# Altium project PGS-System.PrjPcb (part 2 of 16)
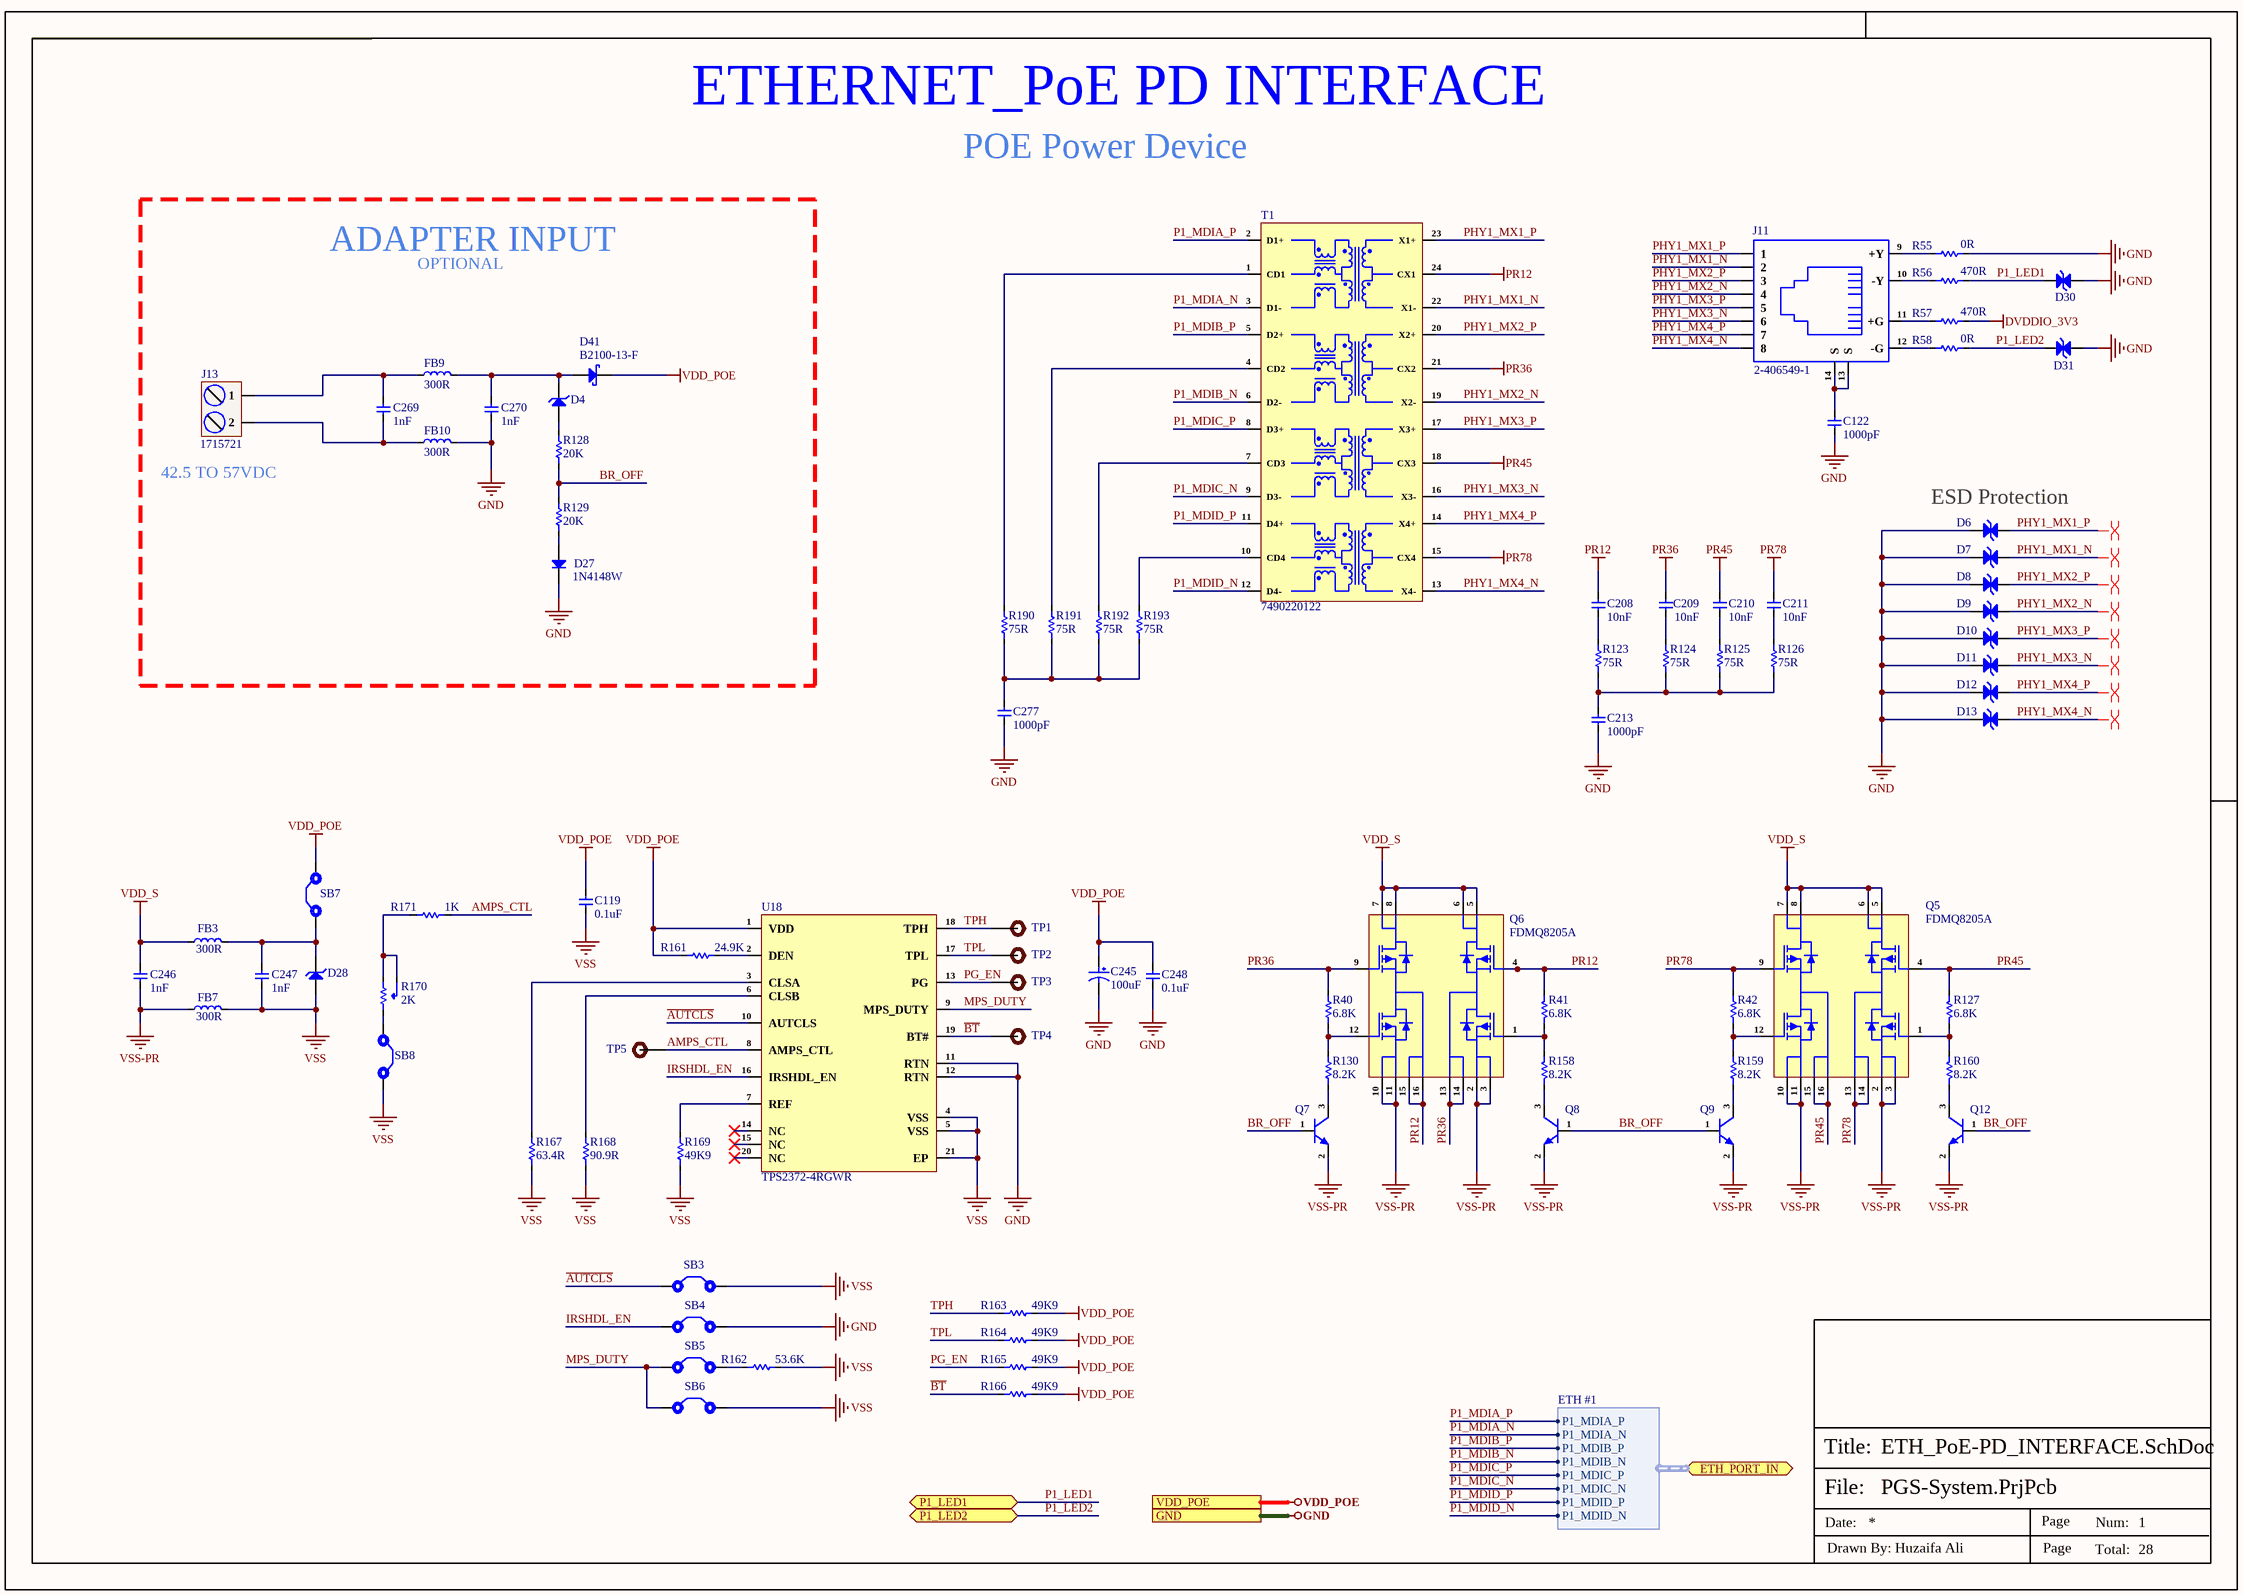
[diagram p106: ETH_PoE-PD_INTERFACE.SchDoc]

## Sheet ETH_PoE-PD_INTERFACE.SchDoc (continued)

### Library data of the parts
C119 C248 = CC0603KRX7R0BB104: CAP CER 0.1UF 100V X7R 0603; Manufacturer: Yageo; Capacitance: 100nF; Tolerance: 10%; Item Type: Capacitor; Supplier 1: Digi-Key; Manufacturer Part Number: CC0603KRX7R0BB104; RoHS: Yes; Category: Ceramic Capacitors; Stock 1: 60476; Pricing 1: 1=0.19000, 10=0.13500, 50=0.07680, 100=0.06370, 500=0.04466, 1000=0.03696 (USD); Mount: Surface Mount; Case/Package: 0603; Case Code (Metric): 1608; Case Code (Imperial): 0603; Weight: 7.1E-05oz; Min Operating Temperature: -55°C; Max Operating Temperature: 125°C; Package Quantity: 4000; Voltage Rating: 100V; Packaging: Tape and Reel; Dielectric: X7R; Termination: SMD/SMT; Resistor Type: Ceramic; Voltage Rating (DC): 100V; Series: CC; Length: 0.063inch; Width: 0.031inch; Thickness: 0.035inch; Depth: 0.8mm; Lead Free: Lead Free; RoHS Compliant: Yes; ComponentLink1URL: https://datasheet.ciiva.com/6277/mlccorderingcode-6277030.pdf?src-supplier=Digi-Key; ComponentLink1Description: https://datasheet.ciiva.com/6277/mlccorderingcode-6277030.pdf?src-supplier=Digi-Key; ComponentLink2URL: https://datasheet.ciiva.com/6277/mlccorderingcode-6277081.pdf?src-supplier=Digi-Key; ComponentLink2Description: https://datasheet.ciiva.com/6277/mlccorderingcode-6277081.pdf?src-supplier=Digi-Key; ComponentLink3URL: https://datasheet.ciiva.com/6277/mlccorderingcode-6277082.pdf?src-supplier=Digi-Key; ComponentLink3Description: https://datasheet.ciiva.com/6277/mlccorderingcode-6277082.pdf?src-supplier=Digi-Key; Supplier Part Number 1: 311-1523-1-ND; LCSC Part Number: C113803
C122 C213 C277 = CC1206KKX7RDBB102: CAP CER 1000PF 2KV X7R 1206; Manufacturer: Yageo; Tolerance: 10%; Capacitance: 1nF; Dissipation Factor: 2.5%; Insulation Resistance: 10GR; Item Type: Capacitor; Supplier 1: Digi-Key; Manufacturer Part Number: CC1206KKX7RDBB102; RoHS: Yes; Category: Ceramic Capacitors; Stock 1: 19260; Pricing 1: 1=0.35000, 10=0.24000, 50=0.16780, 100=0.14390, 500=0.10794, 1000=0.09114 (USD); Mount: Surface Mount; Case/Package: 1206; Number of Pins: 2; Case Code (Metric): 3216; Case Code (Imperial): 1206; Min Operating Temperature: -55°C; Max Operating Temperature: 125°C; Dielectric: X7R; Voltage: 2kV; Package Quantity: 1; Voltage Rating: 2kV; Packaging: Tape and Reel; Voltage Rating (DC): 2kV; Termination: SMD/SMT; Resistor Type: Ceramic; Series: CC; Construction: Flat; Length: 3.2mm; Width: 0.063inch; Height: 1.25mm; Depth: 1.6mm; Thickness: 0.057inch; Radiation Hardening: No; RoHS Compliant: Yes; REACH SVHC: Unknown; Lead Free: Lead Free; ComponentLink1URL: https://datasheet.ciiva.com/23942/1449957-23942422.pdf?src-supplier=Newark; ComponentLink1Description: https://datasheet.ciiva.com/23942/1449957-23942422.pdf?src-supplier=Newark; ComponentLink2URL: https://datasheet.ciiva.com/186/upy-np0x7r-hv-1kv-to-3kv-4-186736.pdf?src-supplier=Digi-Key; ComponentLink2Description: https://datasheet.ciiva.com/186/upy-np0x7r-hv-1kv-to-3kv-4-186736.pdf?src-supplier=Digi-Key; ComponentLink3URL: https://datasheet.ciiva.com/186/upy-np0x7r-hv-1kv-to-3kv-4-186737.pdf?src-supplier=Digi-Key; ComponentLink3Description: https://datasheet.ciiva.com/186/upy-np0x7r-hv-1kv-to-3kv-4-186737.pdf?src-supplier=Digi-Key; ComponentLink4URL: https://datasheet.ciiva.com/13386/upy-gp-np0-16v-to-50v-8-13386312.pdf?src-supplier=Mouser; ComponentLink4Description: https://datasheet.ciiva.com/13386/upy-gp-np0-16v-to-50v-8-13386312.pdf?src-supplier=Mouser; ComponentLink5URL: https://datasheet.ciiva.com/186/upy-np0x7r-hv-1kv-to-3kv-4-186735.pdf?src-supplier=Digi-Key; ComponentLink5Description: https://datasheet.ciiva.com/186/upy-np0x7r-hv-1kv-to-3kv-4-186735.pdf?src-supplier=Digi-Key; Supplier Part Number 1: 311-1487-1-ND; LCSC Part Number: C23631
C208-C211 = CC0402KRX7R9BB103: CAP CER 10000PF 50V X7R 0402; Manufacturer: Yageo; Tolerance: 10%; Item Type: Capacitor; Supplier 1: Avnet; Manufacturer Part Number: CC0402KRX7R9BB103; RoHS: Yes; Category: Ceramic Capacitors; Stock 1: 995000; Pricing 1: 10000=0.00178 (USD); Mount: Surface Mount; Case/Package: 0402; Case Code (Imperial): 0402; Case Code (Metric): 1005; Min Operating Temperature: -55°C; Max Operating Temperature: 125°C; Capacitance: 10nF; Dielectric: X7R; Packaging: Tape and Reel; Voltage Rating: 50V; Voltage Rating (DC): 50V; Package Quantity: 1; Termination: SMD/SMT; Resistor Type: Ceramic; Voltage: 50V; Series: CC; Length: 1mm; Width: 0.02inch; Height: 0.5mm; Thickness: 0.022inch; Depth: 0.5mm; Radiation Hardening: No; RoHS Compliant: Yes; Reach SVHC Compliant: Yes; Lead Free: Lead Free; Halogen Free: Halogen Free; ComponentLink1URL: https://datasheet.ciiva.com/11788/0900766b8079c870-11788375.pdf?src-supplier=RSComponents; ComponentLink1Description: https://datasheet.ciiva.com/11788/0900766b8079c870-11788375.pdf?src-supplier=RSComponents; ComponentLink2URL: https://datasheet.ciiva.com/26862/getdatasheetpartid-138248-26862642.pdf?src-supplier=Verical; ComponentLink2Description: https://datasheet.ciiva.com/26862/getdatasheetpartid-138248-26862642.pdf?src-supplier=Verical; ComponentLink3URL: https://datasheet.ciiva.com/7978/1489800-7978093.pdf?src-supplier=Element14; ComponentLink3Description: https://datasheet.ciiva.com/7978/1489800-7978093.pdf?src-supplier=Element14; ComponentLink4URL: https://datasheet.ciiva.com/28450/1489800-28450377.pdf?src-supplier=Element14; ComponentLink4Description: https://datasheet.ciiva.com/28450/1489800-28450377.pdf?src-supplier=Element14; ComponentLink5URL: https://datasheet.ciiva.com/176/mlccorderingcode-176349.pdf?src-supplier=Digi-Key; ComponentLink5Description: https://datasheet.ciiva.com/176/mlccorderingcode-176349.pdf?src-supplier=Digi-Key; ComponentLink6URL: https://datasheet.ciiva.com/176/mlccorderingcode-176348.pdf?src-supplier=Digi-Key; ComponentLink6Description: https://datasheet.ciiva.com/176/mlccorderingcode-176348.pdf?src-supplier=Digi-Key; ComponentLink7URL: https://datasheet.ciiva.com/176/mlccorderingcode-176350.pdf?src-supplier=Digi-Key; ComponentLink7Description: https://datasheet.ciiva.com/176/mlccorderingcode-176350.pdf?src-supplier=Digi-Key; Supplier Part Number 1: CC0402KRX7R9BB103; LCSC Part Number: C60133
C245 = EEE-FK2A101AM: CAP ALUM 100UF 20% 100V SMD; Manufacturer: Panasonic; Item Type: Capacitor; Ripple Current: 793mA; Impedance: 170mR; Life (Hours): 5000Hour; Dissipation Factor: 0.07%; Supplier: Mouser; LCSC Part Number: C178569; Manufacturer Part Number: EEE-FK2A101AM; RoHS: Yes; Stock: 2720; Pricing: 1=2.26, 10=1.74, 50=1.49, 100=1.49, 1000=1.13, 10000=0.876 (USD); Mounting Technology: Surface Mount,PCB; Case/Package: Radial; Min Operating Temperature: -55°C; Max Operating Temperature: 105°C; Value: 100uF; Voltage Rating: 100V; Tolerance: 20%; Packaging: Tape and Reel; Package Quantity: 1; Voltage Rating (DC): 100V; ESR (Equivalent Series Resistance): 170mR; Ripple Current (AC): 793mA; Termination: SMD/SMT; Voltage: 100V; Series: FK; Construction: Cylindrical; Diameter: 16mm; Length: 16.5mm; Height: 16.5mm; Height - Seated (Max): 0.65inch; Radiation Hardening: No; Reach SVHC Compliant: No; RoHS Compliant: Yes; Lead Free: 5697LeadFree
C246 C247 C269 C270 = 06031C102JAT2A: CAP CER 1000PF 100V X7R 0603; Manufacturer: Kyocera AVX; Item Type: Capacitor; Material: 4241ConductorMaterial; Supplier: Future Electronics; LCSC Part Number: C2179225; Manufacturer Part Number: 06031C102JAT2A; RoHS: Yes; Stock: 32000; Pricing: 4000=0.0243, 12000=0.0234, 20000=0.023, 40000=0.0225, 80000=0.0216 (USD); Lead Free: 5697LeadFree; ComponentLink1URL: https://datasheet.ciiva.com/27056/2011951-27056177.pdf?src-supplier=Jameco; ComponentLink1Description: https://datasheet.ciiva.com/27056/2011951-27056177.pdf?src-supplier=Jameco; ComponentLink2URL: https://datasheet.ciiva.com/2987/cx7r-2987732.pdf?src-supplier=Avnet; ComponentLink2Description: https://datasheet.ciiva.com/2987/cx7r-2987732.pdf?src-supplier=Avnet; ComponentLink3URL: https://datasheet.ciiva.com/151/cx7r-151600.pdf?src-supplier=Digikey; ComponentLink3Description: https://datasheet.ciiva.com/151/cx7r-151600.pdf?src-supplier=Digikey; ComponentLink4URL: https://datasheet.ciiva.com/151/cx7r-151601.pdf?src-supplier=Digikey; ComponentLink4Description: https://datasheet.ciiva.com/151/cx7r-151601.pdf?src-supplier=Digikey; ComponentLink5URL: https://datasheet.ciiva.com/151/cx7r-151602.pdf?src-supplier=Digikey; ComponentLink5Description: https://datasheet.ciiva.com/151/cx7r-151602.pdf?src-supplier=Digikey; ComponentLink6URL: https://datasheet.ciiva.com/1124/1679506-1124194.pdf?src-supplier=Element14; ComponentLink6Description: https://datasheet.ciiva.com/1124/1679506-1124194.pdf?src-supplier=Element14; ComponentLink7URL: https://datasheet.ciiva.com/1124/1679506-1124195.pdf?src-supplier=Element14; ComponentLink7Description: https://datasheet.ciiva.com/1124/1679506-1124195.pdf?src-supplier=Element14; ComponentLink8URL: https://datasheet.ciiva.com/7855/1679506-7855032.pdf?src-supplier=Element14; ComponentLink8Description: https://datasheet.ciiva.com/7855/1679506-7855032.pdf?src-supplier=Element14; ComponentLink9URL: https://datasheet.ciiva.com/16286/cx7r-16286463.pdf?src-supplier=Future+Electronics; ComponentLink9Description: https://datasheet.ciiva.com/16286/cx7r-16286463.pdf?src-supplier=Future+Electronics
D4 = MMSZ5242BS-7-F: DIODE ZENER 12V 200MW SOD323; Manufacturer: Diodes; Supplier: Future Electronics; LCSC Part Number: C151457; Manufacturer Part Number: MMSZ5242BS-7-F; RoHS: Yes; Item Type: Diodes; Stock: 15000; Pricing: 3000=0.0228, 9000=0.022, 15000=0.0216, 60000=0.0206, 90000=0.02 (USD); ComponentLink1URL: https://datasheet.ciiva.com/4734/ds31038-62930-4734288.pdf?src-supplier=Mouser; ComponentLink1Description: https://datasheet.ciiva.com/4734/ds31038-62930-4734288.pdf?src-supplier=Mouser; ComponentLink2URL: https://datasheet.ciiva.com/892/ds31038-892105.pdf?src-supplier=Digikey; ComponentLink2Description: https://datasheet.ciiva.com/892/ds31038-892105.pdf?src-supplier=Digikey; ComponentLink3URL: https://datasheet.ciiva.com/892/ds31038-892106.pdf?src-supplier=Digikey; ComponentLink3Description: https://datasheet.ciiva.com/892/ds31038-892106.pdf?src-supplier=Digikey; ComponentLink4URL: https://datasheet.ciiva.com/892/ds31038-892107.pdf?src-supplier=Digikey; ComponentLink4Description: https://datasheet.ciiva.com/892/ds31038-892107.pdf?src-supplier=Digikey; ComponentLink5URL: https://datasheet.ciiva.com/8347/ds31038-8347977.pdf?src-supplier=Avnet; ComponentLink5Description: https://datasheet.ciiva.com/8347/ds31038-8347977.pdf?src-supplier=Avnet
D6-D13 D30 D31 = ESD9X5VU: DFN1006-2 ESD Protection Devices ROHS; Manufacturer: TECH PUBLIC; Manufacturer Part Number: ESD9X5VU; Footprint: DFN1006-2; ComponentLink1Description: LCSC; ComponentLink1URL: https://www.lcsc.com/product-detail/span-style-background-color-ff0-ESD-span-Protection-Devices_TECH-PUBLIC-ESD9X5VU_C2875160.html; LCSC Part Number: C2875160
D27 = 1N4148W: 100V 400mW Single 1.25V@150mA 8ns 300mA SOD-123 Switching Diode ROHS; Manufacturer: JSMSEMI; ComponentLink1Description: LCSC; ComponentLink1URL: https://www.lcsc.com/product-detail/Switching-Diode_JSMSEMI-1N4148W_C917030.html; Manufacturer Part Number: 1N4148W; Package: SOD-123; LCSC Part Number: C917030; Item Type: Diode
D28 = SMBJ58A-13-F: TVS DIODE 58VWM 93.6VC SMB; Manufacturer: Diodes; Supplier: Future Electronics; LCSC Part Number: C135085; Manufacturer Part Number: SMBJ58A-13-F; RoHS: Yes; Item Type: Diode; Stock: 6000; Pricing: 3000=0.0711, 9000=0.0684, 15000=0.0671, 30000=0.0655, 60000=0.063 (USD); ComponentLink1URL: https://datasheet.ciiva.com/25624/0900766b8104bed2-25624843.pdf?src-supplier=Rs; ComponentLink1Description: https://datasheet.ciiva.com/25624/0900766b8104bed2-25624843.pdf?src-supplier=Rs; ComponentLink2URL: https://datasheet.ciiva.com/15143/getdatasheetpartid-39642-15143045.pdf?src-supplier=Verical; ComponentLink2Description: https://datasheet.ciiva.com/15143/getdatasheetpartid-39642-15143045.pdf?src-supplier=Verical; ComponentLink3URL: https://datasheet.ciiva.com/4520/ds19002-4520617.pdf?src-supplier=Mouser; ComponentLink3Description: https://datasheet.ciiva.com/4520/ds19002-4520617.pdf?src-supplier=Mouser; ComponentLink4URL: https://datasheet.ciiva.com/16393/ds19002-16393005.pdf?src-supplier=Future+Electronics; ComponentLink4Description: https://datasheet.ciiva.com/16393/ds19002-16393005.pdf?src-supplier=Future+Electronics
D41 = B2100-13-F: DIODE SCHOTTKY 100V 2A SMB; Manufacturer: Diodes; Package Body Material: Plastic; Diode Element Material: SILICON; Max Reverse Current: 500uA; Peak Non-Repetitive Surge Current: 50A; Number of Elements: 1; Forward Voltage: 790mV; Polarity: Standard; Value: 75pF; Application(s): EFFICIENCY; Diode Type: RECTIFIER; Time @ Peak Reflow Temperature-Max (s): 5s; Supplier: Future Electronics; LCSC Part Number: C110479; Manufacturer Part Number: B2100-13-F; RoHS: Yes; Item Type: Diode; Stock: 591000; Pricing: 3000=0.0991, 6000=0.0966, 12000=0.0942, 15000=0.0934, 45000=0.0888 (USD); Mounting Technology: Surface Mount; Case/Package: SMB; Pins: 2; Weight: 0.00328oz; Package Shape: Rectangular; Terminal Finish: Tin; Min Operating Temperature: -65°C; Max Operating Temperature: 150°C; Forward Current: 2A; Max Repetitive Reverse Voltage (Vrrm): 100V; Package Quantity: 3000; Packaging: Tape and Reel; Average Rectified Current: 2A; Max Forward Surge Current (Ifsm): 50A; Termination: SMD/SMT; Voltage Rating (DC): 100V; Current Rating: 2A; Output Current: 2A; Max Reverse Voltage (DC): 100V; Series: -; JESD-30 Code: R-PDSO-C2; Terminal Form: C BEND; Terminal Position: DUAL; Number of Phases: 1; Surface Mount: Yes; Moisture Sensitivity Level: 1; Technology: SCHOTTKY; Peak Reflow Temperature (Cel): 245°C; Reverse Voltage: 100V; Length: 4.57mm; Width: 3.94mm; Height: 2.62mm; Radiation Hardening: No; Reach SVHC Compliant: No; Lead Free: Lead Free; RoHS Compliant: Yes; ComponentLink1URL: https://datasheet.ciiva.com/34302/1538742-34302357.pdf?src-supplier=Jameco; ComponentLink1Description: https://datasheet.ciiva.com/34302/1538742-34302357.pdf?src-supplier=Jameco; ComponentLink2URL: https://datasheet.ciiva.com/1177/ds30021-1177418.pdf?src-supplier=Element14; ComponentLink2Description: https://datasheet.ciiva.com/1177/ds30021-1177418.pdf?src-supplier=Element14; ComponentLink3URL: https://datasheet.ciiva.com/4715/ds30021-83821-4715727.pdf?src-supplier=Mouser; ComponentLink3Description: https://datasheet.ciiva.com/4715/ds30021-83821-4715727.pdf?src-supplier=Mouser; ComponentLink4URL: https://datasheet.ciiva.com/8300/ds30021-8300525.pdf?src-supplier=Avnet; ComponentLink4Description: https://datasheet.ciiva.com/8300/ds30021-8300525.pdf?src-supplier=Avnet; ComponentLink5URL: https://datasheet.ciiva.com/16217/ds30021-16217820.pdf?src-supplier=Future+Electronics; ComponentLink5Description: https://datasheet.ciiva.com/16217/ds30021-16217820.pdf?src-supplier=Future+Electronics; ComponentLink6URL: https://datasheet.ciiva.com/8303/ds30021-8303003.pdf?src-supplier=Avnet; ComponentLink6Description: https://datasheet.ciiva.com/8303/ds30021-8303003.pdf?src-supplier=Avnet; ComponentLink7URL: https://datasheet.ciiva.com/913/ds30021-913956.pdf?src-supplier=Digikey; ComponentLink7Description: https://datasheet.ciiva.com/913/ds30021-913956.pdf?src-supplier=Digikey; ComponentLink8URL: https://datasheet.ciiva.com/913/ds30021-913957.pdf?src-supplier=Digikey; ComponentLink8Description: https://datasheet.ciiva.com/913/ds30021-913957.pdf?src-supplier=Digikey; ComponentLink9URL: https://datasheet.ciiva.com/913/ds30021-913955.pdf?src-supplier=Digikey; ComponentLink9Description: https://datasheet.ciiva.com/913/ds30021-913955.pdf?src-supplier=Digikey
FB3 FB7 FB9 FB10 = 742792641: FERRITE BEAD 300 OHM 0603 1LN; Manufacturer: Wurth Electronics; RMS Current (Irms): 2A; ESR: 150mR; Tolerance: 25%; Number of Lines: 1; Test Frequency: 100MHz; Value: 18nH; Supplier: Digikey; LCSC Part Number: C2649308; Manufacturer Part Number: 742792641; RoHS: Yes; Item Type: Ferrite Bead; Stock: 95770; Pricing: 1=0.18, 50=0.179, 100=0.165, 500=0.158, 1000=0.15, 2000=0.143 (USD); Mounting Technology: Surface Mount; Case/Package: SMD/SMT; Weight: 0.000141oz; Core Material: Ferrite; Case Code (Metric): 1608; Case Code (Imperial): 0603; Material: Ferrite; Min Operating Temperature: -55°C; Max Operating Temperature: 125°C; Package Quantity: 1; Current Rating: 2A; Packaging: Tape and Reel; Impedance: 300R; Max Current Rating: 2A; Max DC Current: 2A; Termination: SMD/SMT; Series: WE-CBF; Length: 1.6mm; Width: 0.8mm; Height: 0.8mm; Depth: 0.8mm; Lead Free: Lead Free; Reach SVHC Compliant: Unknown; RoHS Compliant: Yes; ComponentLink1URL: https://datasheet.ciiva.com/1466/1705830-1466501.pdf?src-supplier=Element14; ComponentLink1Description: https://datasheet.ciiva.com/1466/1705830-1466501.pdf?src-supplier=Element14; ComponentLink2URL: https://datasheet.ciiva.com/11800/0900766b80d2e072-11800409.pdf?src-supplier=Rs; ComponentLink2Description: https://datasheet.ciiva.com/11800/0900766b80d2e072-11800409.pdf?src-supplier=Rs; ComponentLink3URL: https://datasheet.ciiva.com/4940/742792641-72209-4940450.pdf?src-supplier=Mouser; ComponentLink3Description: https://datasheet.ciiva.com/4940/742792641-72209-4940450.pdf?src-supplier=Mouser; ComponentLink4URL: https://datasheet.ciiva.com/1013/742792641-1013888.pdf?src-supplier=Digikey; ComponentLink4Description: https://datasheet.ciiva.com/1013/742792641-1013888.pdf?src-supplier=Digikey; ComponentLink5URL: https://datasheet.ciiva.com/1466/1705830-1466502.pdf?src-supplier=Element14; ComponentLink5Description: https://datasheet.ciiva.com/1466/1705830-1466502.pdf?src-supplier=Element14; ComponentLink6URL: https://datasheet.ciiva.com/1013/742792641-1013889.pdf?src-supplier=Digikey; ComponentLink6Description: https://datasheet.ciiva.com/1013/742792641-1013889.pdf?src-supplier=Digikey
J11 = 2-406549-1: CONN MOD JACK 8P8C R/A SHIELDED; Manufacturer: TE Connectivity; Item Type: Ethernet Connectors; Supplier: Future Electronics; LCSC Part Number: C125068; Manufacturer Part Number: 2-406549-1; RoHS: Yes; Stock: 6608; Pricing: 1=2.16, 30=2.1, 100=2.04, 200=2, 500=1.9 (USD)
J13 = 1715721: TERM BLK 2P SIDE ENT 5.08MM PCB; Manufacturer: Phoenix Contact; Item Type: Terminal Blocks; Supplier: Digikey; Supplier Part Number: 277-1263-ND; Manufacturer Part Number: 1715721; RoHS: Yes; Stock: 13160; Pricing: 1=0.94 (USD); ComponentLink1URL: https://datasheet.ciiva.com/1120/1697161-1120393.pdf?src-supplier=Farnell; ComponentLink1Description: https://datasheet.ciiva.com/1120/1697161-1120393.pdf?src-supplier=Farnell; ComponentLink2URL: https://datasheet.ciiva.com/832/1715721-832095.pdf?src-supplier=Digikey; ComponentLink2Description: https://datasheet.ciiva.com/832/1715721-832095.pdf?src-supplier=Digikey; ComponentLink3URL: https://datasheet.ciiva.com/15169/getdatasheetpartid-212174-15169929.pdf?src-supplier=Verical; ComponentLink3Description: https://datasheet.ciiva.com/15169/getdatasheetpartid-212174-15169929.pdf?src-supplier=Verical; ComponentLink4URL: https://datasheet.ciiva.com/16046/1715721-16046034.pdf?src-supplier=Onlinecomponents.com; ComponentLink4Description: https://datasheet.ciiva.com/16046/1715721-16046034.pdf?src-supplier=Onlinecomponents.com
Q5 Q6 = FDMQ8205A: GREENBRIDGETM 2 SERIES OF HIGH-E; Manufacturer: ON Semiconductor / Fairchild; Item Type: Mosfet; FET Type: N and P-Channel; Operating Supply Current: 400uA; Max Power Dissipation: 780mW; Max Supply Voltage: 57V; Number of Outputs: 2NUMBER; Supplier: Mouser; Supplier Part Number: 512-FDMQ8205A; Manufacturer Part Number: FDMQ8205A; RoHS: Yes; Stock: 84; Pricing: 1=3.2, 10=2.69, 50=2.69, 100=2.18, 1000=1.66, 10000=1.56 (USD); Mounting Technology: Surface Mount; Weight: 0.21g; Min Operating Temperature: -40°C; Max Operating Temperature: 85°C; Packaging: Cut Tape; Series: GreenBridge™; Output Voltage: 57V; Height: 800um; RoHS Compliant: Yes; ComponentLink1URL: http://www.farnell.com/datasheets/2724479.pdf?src-supplier=Farnell; ComponentLink1Description: http://www.farnell.com/datasheets/2724479.pdf?src-supplier=Farnell; ComponentLink2URL: http://www.onsemi.com/pub/Collateral/FDMQ8205A-D.pdf?src-supplier=Digikey; ComponentLink2Description: http://www.onsemi.com/pub/Collateral/FDMQ8205A-D.pdf?src-supplier=Digikey; ComponentLink3URL: http://www.farnell.com/datasheets/2724479.pdf?src-supplier=Newark; ComponentLink3Description: http://www.farnell.com/datasheets/2724479.pdf?src-supplier=Newark
Q7-Q9 Q12 = MMBTA06-7-F: TRANS NPN 80V 0.5A SOT23-3; Manufacturer: Diodes; Item Type: BJTs; Current Rating: 500mA; Supplier: Future Electronics; Supplier Part Number: 2136300; Manufacturer Part Number: MMBTA06-7-F; RoHS: Yes; Stock: 573000; Pricing: 3000=0.021, 9000=0.0202, 30000=0.0194, 60000=0.019, 120000=0.0182 (USD); Voltage Rating (DC): 80V; Lead Free: 5697LeadFree; ComponentLink1URL: https://datasheet.ciiva.com/19482/1540800-19482686.pdf?src-supplier=Jameco; ComponentLink1Description: https://datasheet.ciiva.com/19482/1540800-19482686.pdf?src-supplier=Jameco; ComponentLink2URL: https://datasheet.ciiva.com/15139/getdatasheetpartid-116057-15139325.pdf?src-supplier=Verical; ComponentLink2Description: https://datasheet.ciiva.com/15139/getdatasheetpartid-116057-15139325.pdf?src-supplier=Verical; ComponentLink3URL: https://datasheet.ciiva.com/972/ds30037-972971.pdf?src-supplier=Digikey; ComponentLink3Description: https://datasheet.ciiva.com/972/ds30037-972971.pdf?src-supplier=Digikey; ComponentLink4URL: https://datasheet.ciiva.com/972/ds30037-972972.pdf?src-supplier=Digikey; ComponentLink4Description: https://datasheet.ciiva.com/972/ds30037-972972.pdf?src-supplier=Digikey; ComponentLink5URL: https://datasheet.ciiva.com/972/ds30037-972973.pdf?src-supplier=Digikey; ComponentLink5Description: https://datasheet.ciiva.com/972/ds30037-972973.pdf?src-supplier=Digikey; ComponentLink6URL: https://datasheet.ciiva.com/11197/ds30037-11197413.pdf?src-supplier=Avnet; ComponentLink6Description: https://datasheet.ciiva.com/11197/ds30037-11197413.pdf?src-supplier=Avnet; ComponentLink7URL: https://datasheet.ciiva.com/4723/ds30037-4723212.pdf?src-supplier=Mouser; ComponentLink7Description: https://datasheet.ciiva.com/4723/ds30037-4723212.pdf?src-supplier=Mouser; ComponentLink8URL: https://datasheet.ciiva.com/22711/1915521-22711756.pdf?src-supplier=Element14; ComponentLink8Description: https://datasheet.ciiva.com/22711/1915521-22711756.pdf?src-supplier=Element14; ComponentLink9URL: https://datasheet.ciiva.com/16298/ds30037-16298441.pdf?src-supplier=Future+Electronics; ComponentLink9Description: https://datasheet.ciiva.com/16298/ds30037-16298441.pdf?src-supplier=Future+Electronics
R40-R42 R127 = RC0402FR-076K8L: RES 6.8K OHM 1% 1/16W 0402; Manufacturer: Yageo; Resistance: 6.8kR; Power Rating: 63mW; Voltage Rating: 50V; Temperature Coefficient: 100ppm/°C; Item Type: Resistor; Supplier 1: Avnet; Manufacturer Part Number: RC0402FR-076K8L; RoHS: Yes; Category: Chip SMD Resistors; Stock 1: 290000; Pricing 1: 10000=0.00085 (USD); Case/Package: 0402; Number of Pins: 2; Case Code (Imperial): 0402; Case Code (Metric): 1005; Size Code: 0402; Min Operating Temperature: -55°C; Max Operating Temperature: 155°C; Packaging: Tape and Reel; Tolerance: 1%; Voltage Rating (DC): 50V; Package Quantity: 1; Termination: SMD/SMT; Resistor Type: Thick Film; Number of Terminations: 2; Max Power Dissipation: 63mW; Features: Moisture Resistant; Series: RC; Construction: Rectangular; Resistance Tolerance: 1%; Technology: THICK FILM; Length: 0.039inch; Width: 0.02inch; Height: 0.016inch; Depth: 0.5mm; Reach SVHC Compliant: Yes; Military Standard: Not; Lead Free: Lead Free; RoHS Compliant: Yes; ComponentLink1URL: https://datasheet.ciiva.com/11819/0900766b80c66297-11819535.pdf?src-supplier=RSComponents; ComponentLink1Description: https://datasheet.ciiva.com/11819/0900766b80c66297-11819535.pdf?src-supplier=RSComponents; ComponentLink2URL: https://datasheet.ciiva.com/2453/pyu-r-int-thick-7-2453500.pdf?src-supplier=Digi-Key; ComponentLink2Description: https://datasheet.ciiva.com/2453/pyu-r-int-thick-7-2453500.pdf?src-supplier=Digi-Key; ComponentLink3URL: https://datasheet.ciiva.com/2453/pyu-r-int-thick-7-2453501.pdf?src-supplier=Digi-Key; ComponentLink3Description: https://datasheet.ciiva.com/2453/pyu-r-int-thick-7-2453501.pdf?src-supplier=Digi-Key; ComponentLink4URL: https://datasheet.ciiva.com/2453/pyu-r-int-thick-7-2453499.pdf?src-supplier=Digi-Key; ComponentLink4Description: https://datasheet.ciiva.com/2453/pyu-r-int-thick-7-2453499.pdf?src-supplier=Digi-Key; ComponentLink5URL: https://datasheet.ciiva.com/12668/pyu-rc0402-51-rohs-l-6-r-12668201.pdf?src-supplier=Mouser; ComponentLink5Description: https://datasheet.ciiva.com/12668/pyu-rc0402-51-rohs-l-6-r-12668201.pdf?src-supplier=Mouser; ComponentLink6URL: https://datasheet.ciiva.com/7850/1018594-7850078.pdf?src-supplier=Element14; ComponentLink6Description: https://datasheet.ciiva.com/7850/1018594-7850078.pdf?src-supplier=Element14; ComponentLink7URL: https://datasheet.ciiva.com/7850/1018594-7850079.pdf?src-supplier=Element14; ComponentLink7Description: https://datasheet.ciiva.com/7850/1018594-7850079.pdf?src-supplier=Element14; ComponentLink8URL: https://datasheet.ciiva.com/16741/pyu-rc0402-51-rohs-l-6-r-16741018.pdf?src-supplier=Future+Electronics; ComponentLink8Description: https://datasheet.ciiva.com/16741/pyu-rc0402-51-rohs-l-6-r-16741018.pdf?src-supplier=Future+Electronics; Supplier Part Number 1: RC0402FR-076K8L; LCSC Part Number: C93940
R55 R58 = RC0402FR-070RL: RES 0 OHM JUMPER 1/16W 0402; Manufacturer: Yageo; Item Type: Resistors; Tolerance: 1%; Power Rating: 62.5mW; Voltage Rating: 50V; Temperature Coefficient: 200ppm/°C; Max Power Dissipation: 63mW; Supplier 1: Mouser; Manufacturer Part Number: RC0402FR-070RL; RoHS: Yes; Stock 1: 8556842; Pricing 1: 1=0.10000, 10=0.01400, 50=0.01400, 100=0.00600, 1000=0.00300, 5000=0.00200, 10000=0.00100 (USD); Mount: Surface Mount; Case/Package: 0402; Contact Plating: Tin,Matte; Case Code (Imperial): 0402; Case Code (Metric): 1005; Size Code: 0402; Min Operating Temperature: -55°C; Max Operating Temperature: 155°C; Resistance: 0R; Resistor Type: Thick Film; Packaging: Tape and Reel; Termination: SMD/SMT; Features: Moisture Resistant; Series: RC; Number of Terminations: 2; Length: 1mm; Width: 0.5mm; Height: 0.35mm; Radiation Hardening: No; Lead Free: Lead Free; RoHS Compliant: Yes; ComponentLink1URL: https://datasheet.ciiva.com/8896/pyu-rc0402-51-rohs-l-6-8896149.pdf?src-supplier=Avnet; ComponentLink1Description: https://datasheet.ciiva.com/8896/pyu-rc0402-51-rohs-l-6-8896149.pdf?src-supplier=Avnet; ComponentLink2URL: https://datasheet.ciiva.com/16790/pyu-rc0402-51-rohs-l-6-r-16790444.pdf?src-supplier=Future+Electronics; ComponentLink2Description: https://datasheet.ciiva.com/16790/pyu-rc0402-51-rohs-l-6-r-16790444.pdf?src-supplier=Future+Electronics; Supplier Part Number 1: 603-RC0402FR-070RL; LCSC Part Number: C106231
R56 R57 = RC0402FR-07470RL: RES 470 OHM 1% 1/16W 0402; Manufacturer: Yageo; Item Type: Resistor; Voltage Rating: 50V; Power Rating: 62.5mW; Temperature Coefficient: 100ppm/°C; Max Power Dissipation: 63mW; Supplier: Avnet; Supplier Part Number: RC0402FR-07470RL; Manufacturer Part Number: RC0402FR-07470RL; RoHS: Yes; Stock: 10000; Pricing: 10000=0.00085 (USD); Case/Package: 0402; Case Code (Metric): 1005; Case Code (Imperial): 0402; Min Operating Temperature: -55°C; Max Operating Temperature: 155°C; Packaging: Tape and Reel; Value: 470R; Tolerance: 1%; Number of Terminations: 2; Working Voltage: 50V; Package Quantity: 1; Resistor Type: Thick Film; Termination: SMD/SMT; Features: Moisture Resistant; Series: RC; Resistance Tolerance: 1%; Construction: Rectangular; Voltage Rating (AC): 50V; Length: 1mm; Width: 0.02inch; Height: 0.016inch; Depth: 0.5mm; Lead Free: Lead Free; Reach SVHC Compliant: No; RoHS Compliant: Yes; Military Standard: Not; ComponentLink1URL: https://datasheet.ciiva.com/46412/1018594-46412838.pdf?src-supplier=Element14; ComponentLink1Description: https://datasheet.ciiva.com/46412/1018594-46412838.pdf?src-supplier=Element14; ComponentLink2URL: https://datasheet.ciiva.com/2453/pyu-r-int-thick-7-2453377.pdf?src-supplier=Digikey; ComponentLink2Description: https://datasheet.ciiva.com/2453/pyu-r-int-thick-7-2453377.pdf?src-supplier=Digikey; ComponentLink3URL: https://datasheet.ciiva.com/2453/pyu-r-int-thick-7-2453378.pdf?src-supplier=Digikey; ComponentLink3Description: https://datasheet.ciiva.com/2453/pyu-r-int-thick-7-2453378.pdf?src-supplier=Digikey; ComponentLink4URL: https://datasheet.ciiva.com/2453/pyu-r-int-thick-7-2453376.pdf?src-supplier=Digikey; ComponentLink4Description: https://datasheet.ciiva.com/2453/pyu-r-int-thick-7-2453376.pdf?src-supplier=Digikey; ComponentLink5URL: https://datasheet.ciiva.com/7850/1018594-7850015.pdf?src-supplier=Element14; ComponentLink5Description: https://datasheet.ciiva.com/7850/1018594-7850015.pdf?src-supplier=Element14; ComponentLink6URL: https://datasheet.ciiva.com/7850/1018594-7850014.pdf?src-supplier=Element14; ComponentLink6Description: https://datasheet.ciiva.com/7850/1018594-7850014.pdf?src-supplier=Element14; ComponentLink7URL: https://datasheet.ciiva.com/15189/getdatasheetpartid-330246-15189463.pdf?src-supplier=Verical; ComponentLink7Description: https://datasheet.ciiva.com/15189/getdatasheetpartid-330246-15189463.pdf?src-supplier=Verical; LCSC Part Number: C114877
R123-R126 R190-R193 = RC0402JR-0775RL: RES 75 OHM 5% 1/16W 0402; Manufacturer: Yageo; Item Type: Resistor; Temperature Coefficient: 100ppm/°C; Power Rating: 62.5mW; Voltage Rating: 50V; Max Power Dissipation: 63mW; Supplier: Digikey; Supplier Part Number: 311-75JRCT-ND; Manufacturer Part Number: RC0402JR-0775RL; RoHS: Yes; Stock: 2993323; Pricing: 1=0.1, 10=0.018, 50=0.0102, 100=0.0083, 500=0.00528, 1000=0.00444, 5000=0.00307 (USD); Case/Package: 0402; Pins: 2; Contact Plating: Tin,Lead; Case Code (Imperial): 0402; Case Code (Metric): 1005; Min Operating Temperature: -55°C; Max Operating Temperature: 155°C; Value: 75R; Tolerance: 5%; Resistor Type: Thick Film; Packaging: Tape and Reel; Termination: SMD/SMT; Voltage Rating (DC): 50V; Features: Moisture Resistant; Series: RC; Number of Terminations: 2; Resistance Tolerance: 5%; Length: 1mm; Width: 0.5mm; Height: 0.35mm; Reach SVHC Compliant: No; Lead Free: Lead Free; RoHS Compliant: Yes; ComponentLink1URL: https://datasheet.ciiva.com/7983/1018594-7983612.pdf?src-supplier=Element14; ComponentLink1Description: https://datasheet.ciiva.com/7983/1018594-7983612.pdf?src-supplier=Element14; ComponentLink2URL: https://datasheet.ciiva.com/17082/pyu-rc0402-51-rohs-l-6-r-17082239.pdf?src-supplier=Future+Electronics; ComponentLink2Description: https://datasheet.ciiva.com/17082/pyu-rc0402-51-rohs-l-6-r-17082239.pdf?src-supplier=Future+Electronics; LCSC Part Number: C137841
R128 R129 = RC0603FR-0720KL: RES 20K OHM 1% 1/10W 0603; Manufacturer: Yageo; Resistance: 20kR; Temperature Coefficient: 100ppm/°C; Voltage Rating (DC): 50V; Power Rating: 100mW; Item Type: Resistor; Supplier 1: Arrow Electronics; Manufacturer Part Number: RC0603FR-0720KL; RoHS: Yes; Category: Chip SMD Resistors; Stock 1: 945000; Pricing 1: 5000=0.00240, 10000=0.00220, 25000=0.00200, 50000=0.00190, 125000=0.00180 (USD); Case/Package: 0603; Number of Pins: 2; Case Code (Imperial): 0603; Case Code (Metric): 1608; Size Code: 0603; Min Operating Temperature: -55°C; Max Operating Temperature: 155°C; Tolerance: 1%; Packaging: Tape and Reel; Resistor Type: Thick Film; Voltage Rating: 50V; Package Quantity: 1; Termination: SMD/SMT; Number of Terminations: 2; Max Power Dissipation: 100mW; Features: Moisture Resistant; Series: RC; Technology: THICK FILM; Construction: Rectangular; Resistance Tolerance: 1%; Length: 0.063inch; Width: 0.031inch; Height: 0.022inch; Depth: 0.8mm; Lead Free: Lead Free; RoHS Compliant: Yes; REACH SVHC: No SVHC; Military Standard: Not; ComponentLink1URL: https://datasheet.ciiva.com/11808/0900766b80f96399-11808275.pdf?src-supplier=RSComponents; ComponentLink1Description: https://datasheet.ciiva.com/11808/0900766b80f96399-11808275.pdf?src-supplier=RSComponents; ComponentLink2URL: https://datasheet.ciiva.com/22747/443971-22747525.pdf?src-supplier=Element14; ComponentLink2Description: https://datasheet.ciiva.com/22747/443971-22747525.pdf?src-supplier=Element14; ComponentLink3URL: https://datasheet.ciiva.com/2453/pyu-r-int-thick-7-2453911.pdf?src-supplier=Digi-Key; ComponentLink3Description: https://datasheet.ciiva.com/2453/pyu-r-int-thick-7-2453911.pdf?src-supplier=Digi-Key; ComponentLink4URL: https://datasheet.ciiva.com/2453/pyu-r-int-thick-7-2453912.pdf?src-supplier=Digi-Key; ComponentLink4Description: https://datasheet.ciiva.com/2453/pyu-r-int-thick-7-2453912.pdf?src-supplier=Digi-Key; ComponentLink5URL: https://datasheet.ciiva.com/2453/pyu-r-int-thick-7-2453910.pdf?src-supplier=Digi-Key; ComponentLink5Description: https://datasheet.ciiva.com/2453/pyu-r-int-thick-7-2453910.pdf?src-supplier=Digi-Key; Supplier Part Number 1: RC0603FR-0720KL; LCSC Part Number: C105575
R130 R158-R160 = RT0402BRD078K2L: RES SMD 8.2K OHM 0.1% 1/16W 0402; Manufacturer: Yageo; Voltage Rating: 50V; Value: 8.2kR; Power Rating: 62.5mW; Temperature Coefficient: 25ppm/°C; Max Power Dissipation: 63mW; Item Type: Resistor; Supplier: Digikey; Supplier Part Number: YAG4318CT-ND; Manufacturer Part Number: RT0402BRD078K2L; RoHS: Yes; Category: Chip SMD Resistors; Stock: 17016; Pricing: 1=0.16, 10=0.121, 50=0.0958, 100=0.0859, 500=0.0654, 1000=0.0578, 5000=0.04283 (USD); Case/Package: 0402; Case Code (Metric): 1005; Case Code (Imperial): 0402; Min Operating Temperature: -55°C; Max Operating Temperature: 155°C; Tolerance: 0.1%; Packaging: Tape and Reel; Package Quantity: 10000; Termination: SMD/SMT; Number of Terminations: 2; Voltage Rating (DC): 50V; Series: RT; Length: 0.039inch; Width: 0.02inch; Height: 0.014inch; Lead Free: Lead Free; RoHS Compliant: Yes; ComponentLink1URL: https://datasheet.ciiva.com/2582/pyu-rt-1-to-0-05-rohs-l-5-2582520.pdf?src-supplier=Digikey; ComponentLink1Description: https://datasheet.ciiva.com/2582/pyu-rt-1-to-0-05-rohs-l-5-2582520.pdf?src-supplier=Digikey; LCSC Part Number: C852943
R161 = 0603WAF2492T5E: 100mW Thick Film Resistors 75V ±100ppm/℃ ±1% 24.9kΩ 0603 Chip Resistor - Surface Mount ROHS; Manufacturer: UNI-ROYAL(Uniroyal Elec); Manufacturer Part Number: 0603WAF2492T5E; Package: 0603; LCSC Part Number: C25962; Item Type: Resistor; ComponentLink1Description: LCSC; ComponentLink1URL: https://www.lcsc.com/product-detail/Chip-Resistor-Surface-Mount_UNI-ROYAL-Uniroyal-Elec-0603WAF2492T5E_C25962.html
R162 = RC0603FR-0753K6L: RES 53.6K OHM 1% 1/10W 0603; Manufacturer: Yageo; Item Type: Resistor; Value: 53.6kR; Temperature Coefficient: 100ppm/°C; Voltage Rating (DC): 50V; Power Rating: 100mW; Supplier: Digikey; LCSC Part Number: C137700; Manufacturer Part Number: RC0603FR-0753K6L; RoHS: Yes; Stock: 308541; Pricing: 1=0.1, 10=0.019, 50=0.0112, 100=0.0093, 500=0.00622, 1000=0.00532 (USD); Mounting Technology: Surface Mount; Case/Package: 0603; Case Code (Imperial): 0603; Case Code (Metric): 1608; Min Operating Temperature: -55°C; Max Operating Temperature: 155°C; Packaging: Tape and Reel; Tolerance: 1%; Voltage Rating: 50V; Termination: SMD/SMT; Features: Moisture Resistant; Series: RC; Max Power Dissipation: 100mW; Number of Terminations: 2; Construction: Rectangular; Technology: THICK FILM; Length: 1.6mm; Height: 0.45mm; Depth: 0.8mm; Lead Free: Lead Free; Military Standard: Not; RoHS Compliant: Yes; ComponentLink1URL: https://datasheet.ciiva.com/11819/0900766b80f96399-11819394.pdf?src-supplier=Rs; ComponentLink1Description: https://datasheet.ciiva.com/11819/0900766b80f96399-11819394.pdf?src-supplier=Rs
R163-R166 R169 = RC0603FR-0749K9L: RES 49.9K OHM 1% 1/10W 0603; Manufacturer: Yageo; Power Rating: 100mW; Resistance: 49.9kR; Temperature Coefficient: 100ppm/°C; Voltage Rating (DC): 50V; Item Type: Resistor; Supplier 1: Digi-Key; Manufacturer Part Number: RC0603FR-0749K9L; RoHS: Yes; Category: Chip SMD Resistors; Stock 1: 77863; Pricing 1: 1=0.10000, 10=0.02400, 100=0.00970, 1000=0.00436, 2500=0.00378 (USD); Mount: Surface Mount; Case/Package: 0603; Case Code (Metric): 1608; Case Code (Imperial): 0603; Size Code: 0603; Min Operating Temperature: -55°C; Max Operating Temperature: 155°C; Tolerance: 1%; Packaging: Tape and Reel; Package Quantity: 1; Voltage Rating: 50V; Resistor Type: Thick Film; Number of Terminations: 2; Termination: SMD/SMT; Max Power Dissipation: 100mW; Features: Moisture Resistant; Series: RC; Construction: Rectangular; Length: 0.063inch; Width: 0.031inch; Height: 0.022inch; Depth: 0.8mm; Lead Free: Lead Free; Military Standard: Not; RoHS Compliant: Yes; ComponentLink1URL: https://datasheet.ciiva.com/2454/pyu-r-int-thick-7-2454042.pdf?src-supplier=Digi-Key; ComponentLink1Description: https://datasheet.ciiva.com/2454/pyu-r-int-thick-7-2454042.pdf?src-supplier=Digi-Key; ComponentLink2URL: https://datasheet.ciiva.com/2454/pyu-r-int-thick-7-2454043.pdf?src-supplier=Digi-Key; ComponentLink2Description: https://datasheet.ciiva.com/2454/pyu-r-int-thick-7-2454043.pdf?src-supplier=Digi-Key; ComponentLink3URL: https://datasheet.ciiva.com/2454/pyu-r-int-thick-7-2454044.pdf?src-supplier=Digi-Key; ComponentLink3Description: https://datasheet.ciiva.com/2454/pyu-r-int-thick-7-2454044.pdf?src-supplier=Digi-Key; ComponentLink4URL: https://datasheet.ciiva.com/15189/getdatasheetpartid-323805-15189749.pdf?src-supplier=Verical; ComponentLink4Description: https://datasheet.ciiva.com/15189/getdatasheetpartid-323805-15189749.pdf?src-supplier=Verical; Supplier Part Number 1: 311-49.9KHRCT-ND; LCSC Part Number: C114624
R167 = AC0603FR-0763R4L: RES SMD 63.4 OHM 1% 1/10W 0603; Manufacturer: Yageo; Item Type: Resistor; Power Rating: 100mW; Voltage Rating: 50V; Temperature Coefficient: 100ppm/°C; Supplier: Digikey; LCSC Part Number: C228004; Manufacturer Part Number: AC0603FR-0763R4L; RoHS: Yes; Stock: 4788; Pricing: 1=0.1, 10=0.021, 50=0.013, 100=0.0108, 500=0.00734, 1000=0.00633 (USD); Case/Package: 0603; Case Code (Imperial): 0603; Case Code (Metric): 1608; Weight: 7.1E-05oz; Min Operating Temperature: -55°C; Max Operating Temperature: 155°C; Tolerance: 1%; Value: 63.4R; Packaging: Tape and Reel; Termination: SMD/SMT; Number of Terminations: 2; Max Power Dissipation: 100mW; Features: Moisture Resistant,Automotive AEC-Q200; Series: AC; Length: 0.063inch; Width: 0.8mm; Height: 0.022inch; RoHS Compliant: Yes; ComponentLink1URL: https://datasheet.ciiva.com/12576/pyu-ac-51-rohs-l-2-12576614.pdf?src-supplier=Mouser; ComponentLink1Description: https://datasheet.ciiva.com/12576/pyu-ac-51-rohs-l-2-12576614.pdf?src-supplier=Mouser
R168 = RT0603BRD0790R9L: RES SMD 90.9 OHM 0.1% 1/10W 0603; Manufacturer: Yageo; Item Type: Resistors; Voltage Rating: 75V; Power Rating: 100mW; Temperature Coefficient: 25ppm/°C; Voltage Rating (DC): 50V; Supplier: Mouser; LCSC Part Number: C861597; Manufacturer Part Number: RT0603BRD0790R9L; RoHS: Yes; Stock: 928; Pricing: 1=0.14, 10=0.104, 50=0.083, 100=0.074, 1000=0.05, 10000=0.032 (USD); Case/Package: 0603; Case Code (Metric): 1608; Case Code (Imperial): 0603; Min Operating Temperature: -55°C; Max Operating Temperature: 155°C; Value: 90.9R; Tolerance: 0.1%; Packaging: Tape and Reel; Termination: SMD/SMT; Series: RT; Max Power Dissipation: 100mW; Number of Terminations: 2; Length: 1.6mm; Width: 800um; Height: 450um; Lead Free: Lead Free; RoHS Compliant: Yes; ComponentLink1URL: https://datasheet.ciiva.com/12721/pyu-rt-1-to-0-05-rohs-l-4-12721693.pdf?src-supplier=Mouser; ComponentLink1Description: https://datasheet.ciiva.com/12721/pyu-rt-1-to-0-05-rohs-l-4-12721693.pdf?src-supplier=Mouser
R170 = 3362P-1-202LF: TRIMMER 2K OHM 0.5W PC PIN TOP; Manufacturer: Bourns; Item Type: Potentiometer; Voltage Rating (AC): 300V; Tolerance: 10%; Value: 2kR; Power Rating: 500mW; Number of Turns: 1; Temperature Coefficient: 100ppm/°C; Supplier: Avnet; LCSC Part Number: C111654; Manufacturer Part Number: 3362P-1-202LF; RoHS: Yes; Stock: 2000; Pricing: 250=0.426, 260=0.417, 510=0.408, 1300=0.399, 2500=0.39, 13000=0.381, 25000=0.375 (USD); Mounting Technology: Through Hole,PCB; Color: 48Colour; Weight: 0.02oz; Min Operating Temperature: -55°C; Max Operating Temperature: 125°C; Voltage Rating: 300V; Packaging: Rail/Tube; Package Quantity: 50; Resistor Type: Cermet; Termination: Pin; Taper: Linear; Max Power Dissipation: 500mW; Series: Trimpot® 3362 - Sealed; Resistance Tolerance: 10%; Technology: CERMET; Length: 0.275inch; Width: 0.26inch; Height: 0.185inch; Depth: 6.99mm; Radiation Hardening: No; Lead Free: Lead Free; Reach SVHC Compliant: No; Military Standard: Not; RoHS Compliant: Yes; ComponentLink1URL: https://datasheet.ciiva.com/3890/41630408s7049825n1506-3890012.pdf?src-supplier=Arrow+Electronics; ComponentLink1Description: https://datasheet.ciiva.com/3890/41630408s7049825n1506-3890012.pdf?src-supplier=Arrow+Electronics; ComponentLink2URL: https://datasheet.ciiva.com/19482/1967467-19482206.pdf?src-supplier=Jameco; ComponentLink2Description: https://datasheet.ciiva.com/19482/1967467-19482206.pdf?src-supplier=Jameco; ComponentLink3URL: https://datasheet.ciiva.com/11830/0900766b8069ccf8-11830890.pdf?src-supplier=Rs; ComponentLink3Description: https://datasheet.ciiva.com/11830/0900766b8069ccf8-11830890.pdf?src-supplier=Rs; ComponentLink4URL: https://datasheet.ciiva.com/29122/447334-da-01-en-trimmer-tht3362p-1-202lf-2k-0-5w-29122266.pdf?src-supplier=Conrad; ComponentLink4Description: https://datasheet.ciiva.com/29122/447334-da-01-en-trimmer-tht3362p-1-202lf-2k-0-5w-29122266.pdf?src-supplier=Conrad; ComponentLink5URL: https://datasheet.ciiva.com/14108/mk3362-dat-e-14108841.pdf?src-supplier=Distrelec; ComponentLink5Description: https://datasheet.ciiva.com/14108/mk3362-dat-e-14108841.pdf?src-supplier=Distrelec; ComponentLink6URL: https://datasheet.ciiva.com/3266/3362-3266301.pdf?src-supplier=Avnet; ComponentLink6Description: https://datasheet.ciiva.com/3266/3362-3266301.pdf?src-supplier=Avnet; ComponentLink7URL: https://datasheet.ciiva.com/2156/3362-2156399.pdf?src-supplier=Digikey; ComponentLink7Description: https://datasheet.ciiva.com/2156/3362-2156399.pdf?src-supplier=Digikey; ComponentLink8URL: https://datasheet.ciiva.com/30125/3362-30125853.pdf?src-supplier=Onlinecomponents.com; ComponentLink8Description: https://datasheet.ciiva.com/30125/3362-30125853.pdf?src-supplier=Onlinecomponents.com; ComponentLink9URL: https://datasheet.ciiva.com/16715/70153603-16715070.pdf?src-supplier=Allied+Electronics; ComponentLink9Description: https://datasheet.ciiva.com/16715/70153603-16715070.pdf?src-supplier=Allied+Electronics; ComponentLink10URL: https://datasheet.ciiva.com/7953/1815116-7953048.pdf?src-supplier=Element14; ComponentLink10Description: https://datasheet.ciiva.com/7953/1815116-7953048.pdf?src-supplier=Element14
R171 = RC0603FR-071KL: RES SMD 1K OHM 1% 1/10W 0603; Manufacturer: Yageo; Resistance: 1kR; Temperature Coefficient: 100ppm/°C; Power Rating: 100mW; Voltage Rating: 50V; Item type: Resistor; ComponentLink1URL: https://www.verical.com/server-webapp/html/getDatasheet?partID=409289&src-supplier=Verical; ComponentLink1Description: https://www.verical.com/server-webapp/html/getDatasheet?partID=409289&src-supplier=Verical; Supplier 1: Digi-Key; Manufacturer Part Number: RC0603FR-071KL; Stock 1: 21472395; Pricing 1: 1=0.1, 10=0.023, 100=0.0094, 1000=0.0042, 2500=0.0037 (USD); Case/Package: 0603; Contact Plating: Tin,Matte; Case Code (Imperial): 0603; Case Code (Metric): 1608; Min Operating Temperature: -55°C; Max Operating Temperature: 155°C; Tolerance: 1%; Composition: Thick Film; Packaging: Tape and Reel; Termination: SMD/SMT; Military Standard: Not; Length: 1.6mm; Height: 0.45mm; Depth: 0.8mm; Radiation Hardening: No; REACH SVHC: No SVHC; Lead Free: Lead Free; ComponentLink2URL: http://documents.rs-components.com/techlib://itc_doclist_GB.htm?stockno=5048928&src-supplier=RSComponents; ComponentLink2Description: http://documents.rs-components.com/techlib://itc_doclist_GB.htm?stockno=5048928&src-supplier=RSComponents; ComponentLink3URL: http://www.yageo.com/documents/recent/PYu-RC0603_51_RoHS_L_4.pdf?src-supplier=Avnet+Europe; ComponentLink3Description: http://www.yageo.com/documents/recent/PYu-RC0603_51_RoHS_L_4.pdf?src-supplier=Avnet+Europe; ComponentLink4URL: http://www.farnell.com/datasheets/2167052.pdf?src-supplier=Element14; ComponentLink4Description: http://www.farnell.com/datasheets/2167052.pdf?src-supplier=Element14; ComponentLink5URL: http://www.farnell.com/datasheets/1868787.pdf?src-supplier=Element14; ComponentLink5Description: http://www.farnell.com/datasheets/1868787.pdf?src-supplier=Element14; ComponentLink6URL: http://www.yageo.com/documents/recent/PYu-RC_Group_51_RoHS_L_2.pdf?src-supplier=Avnet; ComponentLink6Description: http://www.yageo.com/documents/recent/PYu-RC_Group_51_RoHS_L_2.pdf?src-supplier=Avnet; ComponentLink7URL: https://www.verical.com/server-webapp/html/getDatasheet?partID=404327&src-supplier=Verical; ComponentLink7Description: https://www.verical.com/server-webapp/html/getDatasheet?partID=404327&src-supplier=Verical; ComponentLink8URL: http://www.farnell.com/datasheets/443971.pdf?src-supplier=Element14; ComponentLink8Description: http://www.farnell.com/datasheets/443971.pdf?src-supplier=Element14; Supplier Part Number 1: 311-1.00KHRDKR-ND; LCSC Part Number: C22548
SB3-SB6 = Solder Bridge 0402: Solder Bridge ON; Manufacturer Part Number: Solder Bridge 0402; Item Type: Solder Bridge
SB7 SB8 = Solder Bridge_1206: Solder Bridge ON; Manufacturer Part Number: Solder Bridge_1206; Item Type: Solder Bridge
T1 = 7490220122: PULSE XFMR 1CT:1CT TX 1CT:1CT RX; Manufacturer: Wurth Electronics; Item Type: Transformers; Value: 350uH; Turns Ratio: 1:1; Supplier: Digikey; Supplier Part Number: 732-10731-1-ND; Manufacturer Part Number: 7490220122; RoHS: Yes; Stock: 1691; Pricing: 1=6.97, 10=6.731, 50=6.321, 100=5.951 (USD); Mounting Technology: Surface Mount; Min Operating Temperature: -40°C; Max Operating Temperature: 85°C; Packaging: Cut Tape; Series: WE-LAN; RoHS Compliant: Yes; ComponentLink1URL: http://www.farnell.com/datasheets/2616617.pdf?src-supplier=Farnell; ComponentLink1Description: http://www.farnell.com/datasheets/2616617.pdf?src-supplier=Farnell; ComponentLink2URL: http://www.farnell.com/datasheets/2616617.pdf?src-supplier=Newark; ComponentLink2Description: http://www.farnell.com/datasheets/2616617.pdf?src-supplier=Newark; ComponentLink3URL: https://katalog.we-online.de/pbs/datasheet/7490220122.pdf?src-supplier=Digikey; ComponentLink3Description: https://katalog.we-online.de/pbs/datasheet/7490220122.pdf?src-supplier=Digikey
TP1-TP5 = TEST POINT 0.5mm Dia: Test Point ON; Item Type: Test Point; Manufacturer Part Number: TEST POINT 0.5mm Dia
U18 = TPS2372-4RGWR: IC POE CNTRL 1 CHANNEL 20VQFN; Manufacturer: Texas Instruments; Supplier: Mouser; LCSC Part Number: C470955; Manufacturer Part Number: TPS2372-4RGWR; RoHS: Yes; Item Type: IC; Stock: 5912; Pricing: 1=3.26, 10=2.78, 50=2.78, 100=2.4, 1000=1.73, 10000=1.54 (USD); ComponentLink1URL: http://www.ti.com/general/docs/suppproductinfo.tsp?distId=10&amp;gotoUrl=http%3A%2F%2Fwww.ti.com%2Flit%2Fgpn%2Ftps2372&src-supplier=Digikey; ComponentLink1Description: http://www.ti.com/general/docs/suppproductinfo.tsp?distId=10&amp;gotoUrl=http%3A%2F%2Fwww.ti.com%2Flit%2Fgpn%2Ftps2372&src-supplier=Digikey; ComponentLink2URL: http://www.ti.com/lit/ds/symlink/tps2372.pdf?src-supplier=Digikey; ComponentLink2Description: http://www.ti.com/lit/ds/symlink/tps2372.pdf?src-supplier=Digikey